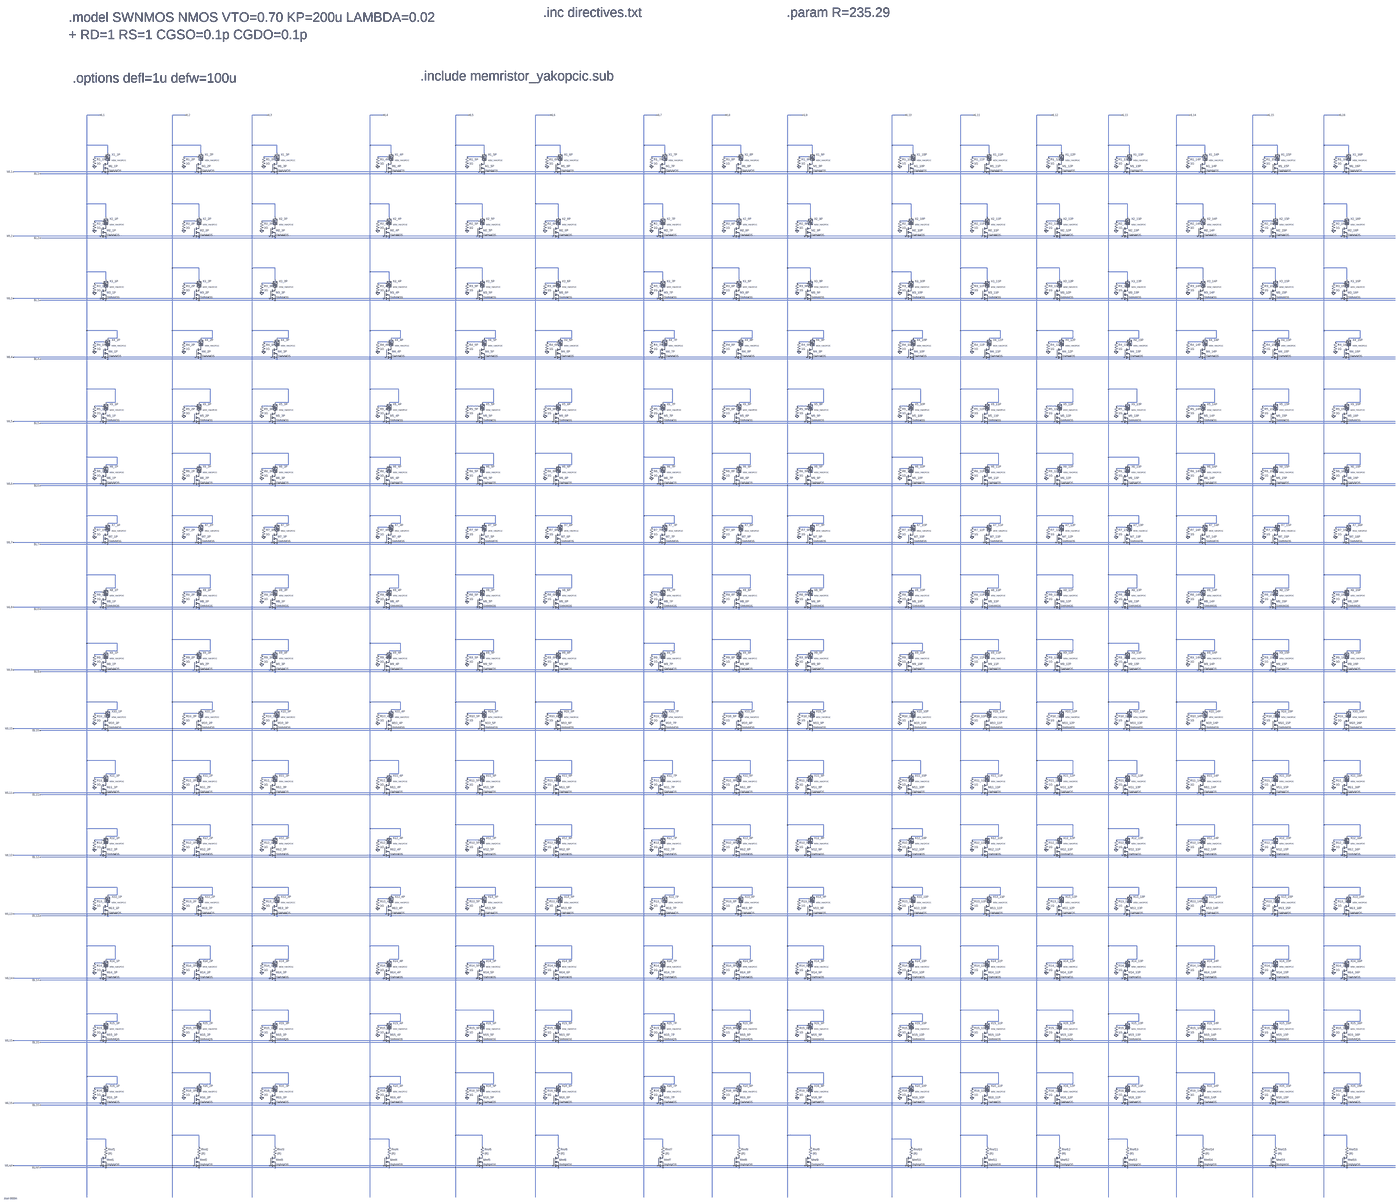
[diagram p0: schematic Trenery-1T1R.asc, whole sheet]
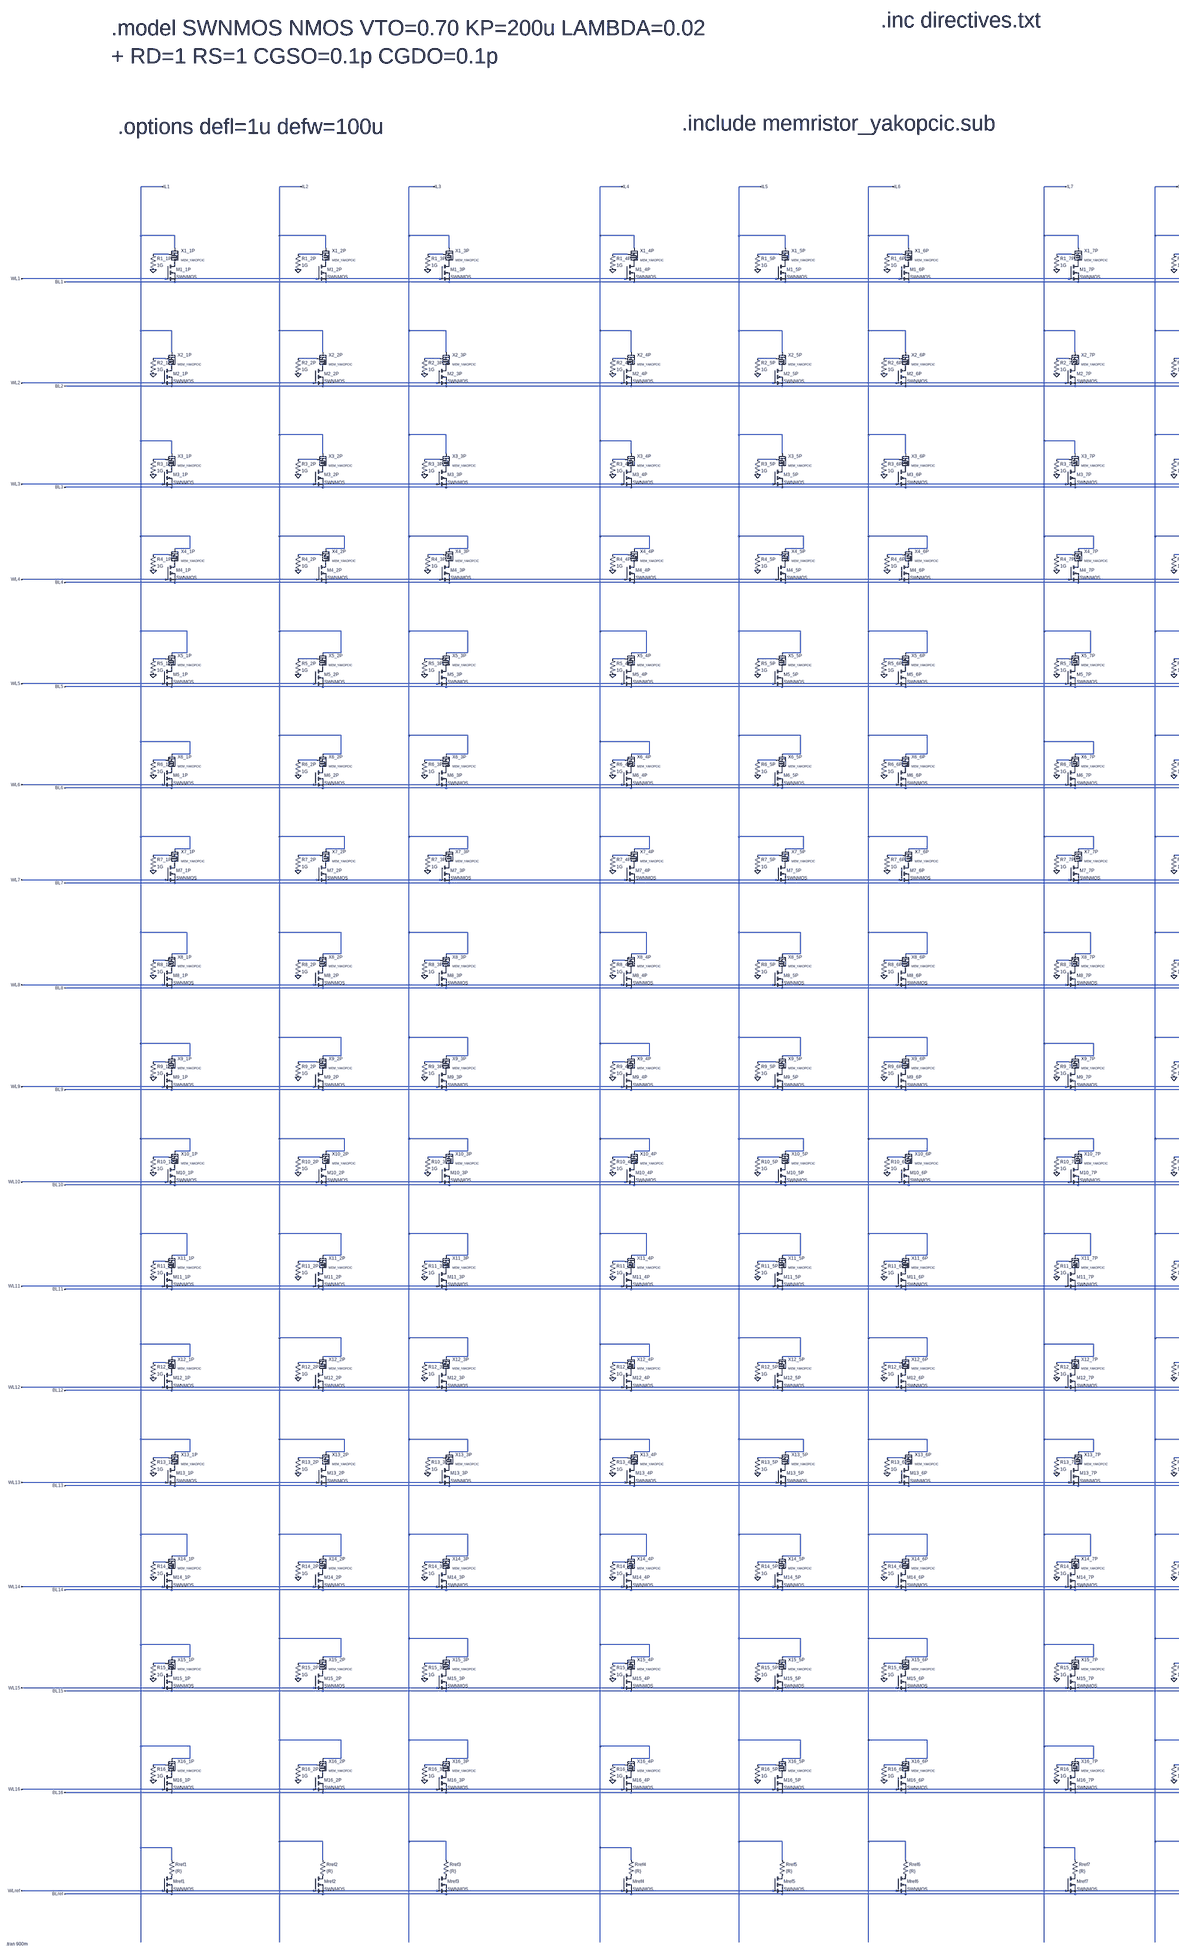
[diagram p1: schematic Trenery-1T1R.asc, part, row 1 of 1, column 1 of 2]
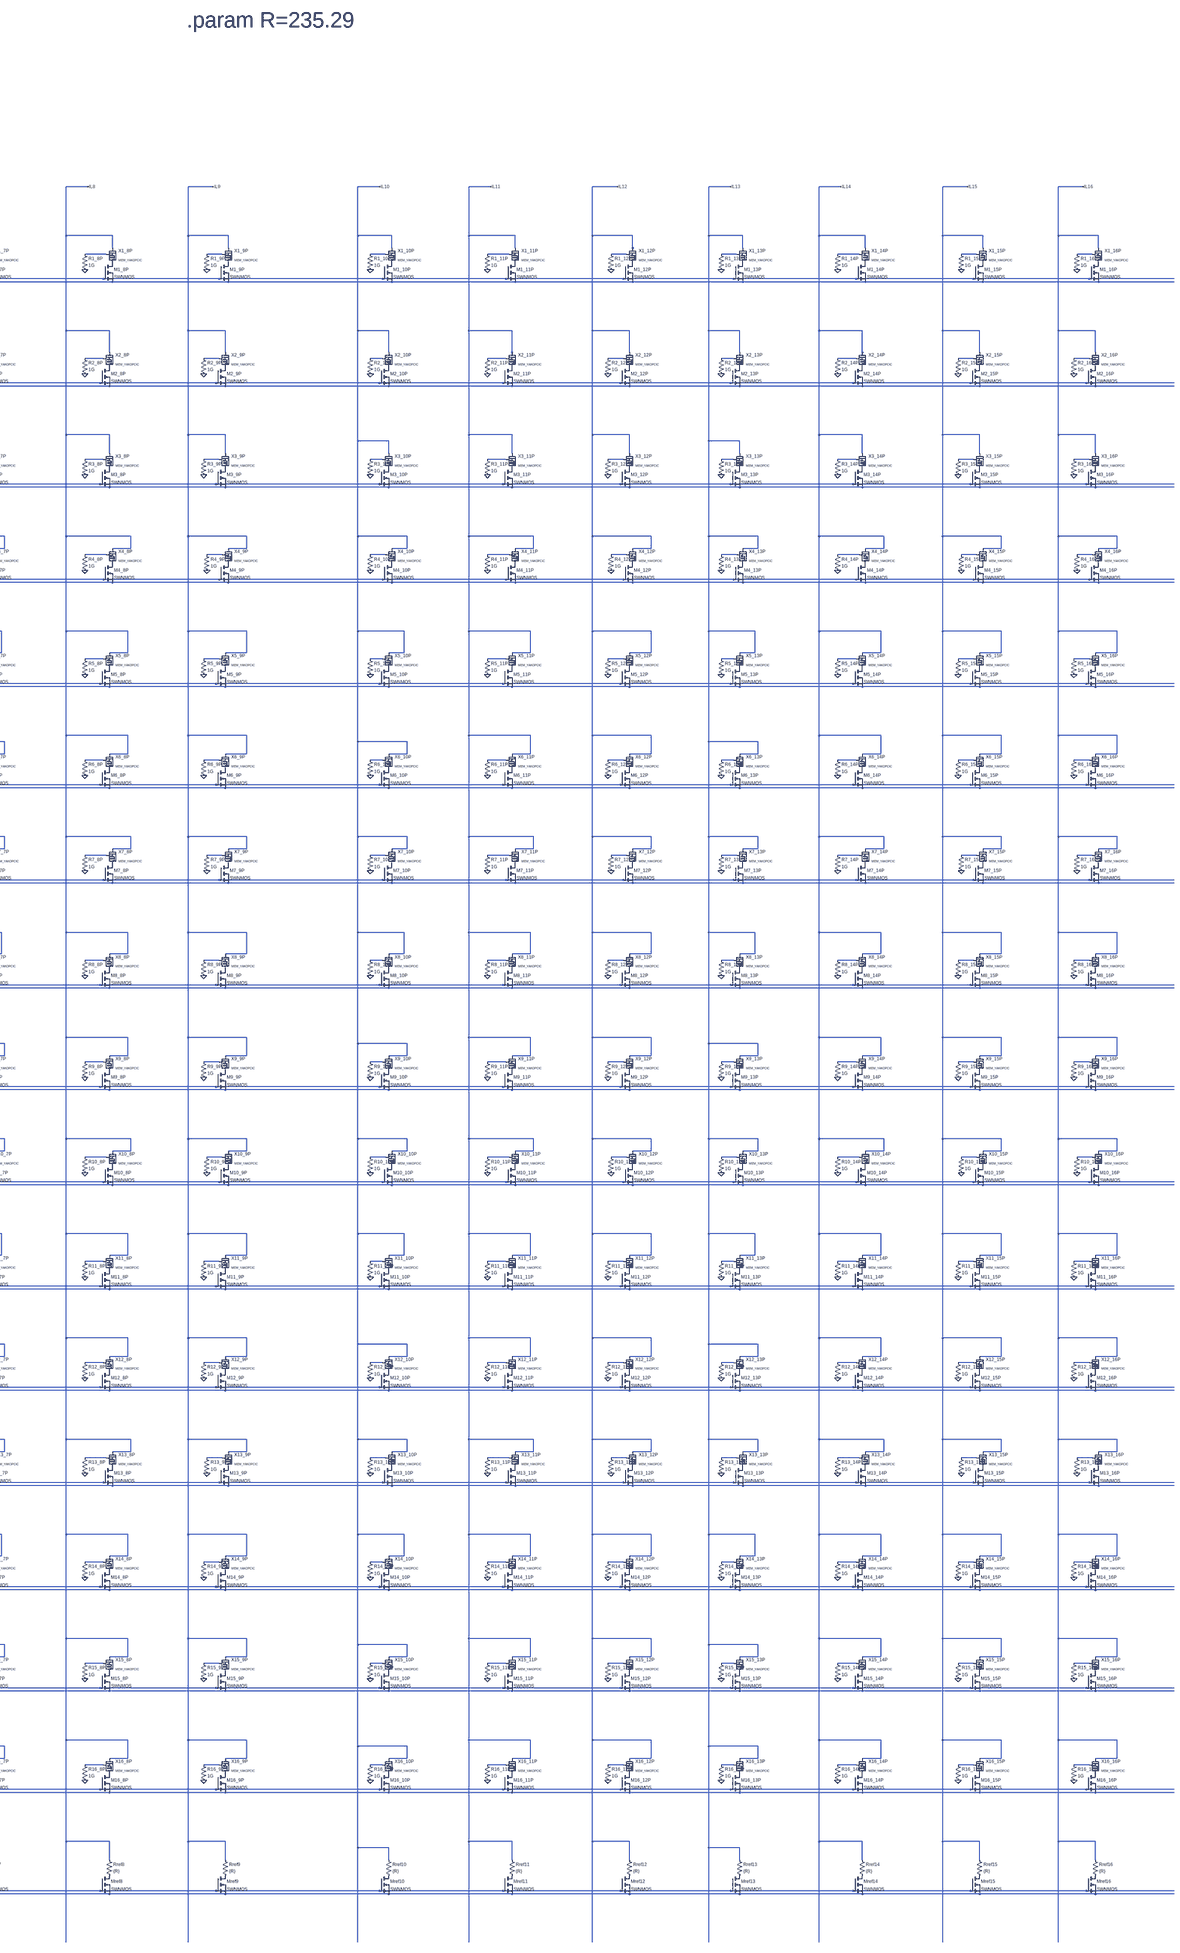
[diagram p2: schematic Trenery-1T1R.asc, part, row 1 of 1, column 2 of 2]
* Trenery-1T1R.asc
M1_1P P001 WL1 BL1 BL1 SWNMOS
M2_1P P002 WL2 BL2 BL2 SWNMOS
M1_2P P003 WL1 BL1 BL1 SWNMOS
M2_2P P004 WL2 BL2 BL2 SWNMOS
M2_3P P005 WL2 BL2 BL2 SWNMOS
M1_3P P006 WL1 BL1 BL1 SWNMOS
M3_1P P007 WL3 BL3 BL3 SWNMOS
M3_2P P008 WL3 BL3 BL3 SWNMOS
M3_3P P009 WL3 BL3 BL3 SWNMOS
X§X2_1P IL1 P002 N017 MEM_YAKOPCIC  ; pins TE BE XSV
X§X2_2P IL2 P004 N018 MEM_YAKOPCIC  ; pins TE BE XSV
X§X2_3P IL3 P005 N019 MEM_YAKOPCIC  ; pins TE BE XSV
X§X1_1P IL1 P001 N001 MEM_YAKOPCIC  ; pins TE BE XSV
X§X1_2P IL2 P003 N002 MEM_YAKOPCIC  ; pins TE BE XSV
X§X1_3P IL3 P006 N003 MEM_YAKOPCIC  ; pins TE BE XSV
X§X3_1P IL1 P007 N033 MEM_YAKOPCIC  ; pins TE BE XSV
X§X3_2P IL2 P008 N034 MEM_YAKOPCIC  ; pins TE BE XSV
X§X3_3P IL3 P009 N035 MEM_YAKOPCIC  ; pins TE BE XSV
R2_1P N017 0 1G
R2_2P N018 0 1G
R2_3P N019 0 1G
R3_1P N033 0 1G
R3_2P N034 0 1G
R3_3P N035 0 1G
R1_1P N001 0 1G tol=1 pwr=0.1
R1_2P N002 0 1G
R1_3P N003 0 1G
M1_4P P010 WL1 BL1 BL1 SWNMOS
M2_4P P011 WL2 BL2 BL2 SWNMOS
M1_5P P012 WL1 BL1 BL1 SWNMOS
M2_5P P013 WL2 BL2 BL2 SWNMOS
M2_6P P014 WL2 BL2 BL2 SWNMOS
M1_6P P015 WL1 BL1 BL1 SWNMOS
M3_4P P016 WL3 BL3 BL3 SWNMOS
M3_5P P017 WL3 BL3 BL3 SWNMOS
M3_6P P018 WL3 BL3 BL3 SWNMOS
X§X2_4P IL4 P011 N020 MEM_YAKOPCIC  ; pins TE BE XSV
X§X2_5P IL5 P013 N021 MEM_YAKOPCIC  ; pins TE BE XSV
X§X2_6P IL6 P014 N022 MEM_YAKOPCIC  ; pins TE BE XSV
X§X1_4P IL4 P010 N004 MEM_YAKOPCIC  ; pins TE BE XSV
X§X1_5P IL5 P012 N005 MEM_YAKOPCIC  ; pins TE BE XSV
X§X1_6P IL6 P015 N006 MEM_YAKOPCIC  ; pins TE BE XSV
X§X3_4P IL4 P016 N036 MEM_YAKOPCIC  ; pins TE BE XSV
X§X3_5P IL5 P017 N037 MEM_YAKOPCIC  ; pins TE BE XSV
X§X3_6P IL6 P018 N038 MEM_YAKOPCIC  ; pins TE BE XSV
R2_4P N020 0 1G
R2_5P N021 0 1G
R2_6P N022 0 1G
R3_4P N036 0 1G
R3_5P N037 0 1G
R3_6P N038 0 1G
R1_4P N004 0 1G tol=1 pwr=0.1
R1_5P N005 0 1G
R1_6P N006 0 1G
M1_7P P019 WL1 BL1 BL1 SWNMOS
M2_7P P020 WL2 BL2 BL2 SWNMOS
M1_8P P021 WL1 BL1 BL1 SWNMOS
M2_8P P022 WL2 BL2 BL2 SWNMOS
M2_9P P023 WL2 BL2 BL2 SWNMOS
M1_9P P024 WL1 BL1 BL1 SWNMOS
M3_7P P025 WL3 BL3 BL3 SWNMOS
M3_8P P026 WL3 BL3 BL3 SWNMOS
M3_9P P027 WL3 BL3 BL3 SWNMOS
X§X2_7P IL7 P020 N023 MEM_YAKOPCIC  ; pins TE BE XSV
X§X2_8P IL8 P022 N024 MEM_YAKOPCIC  ; pins TE BE XSV
X§X2_9P IL9 P023 N025 MEM_YAKOPCIC  ; pins TE BE XSV
X§X1_7P IL7 P019 N007 MEM_YAKOPCIC  ; pins TE BE XSV
X§X1_8P IL8 P021 N008 MEM_YAKOPCIC  ; pins TE BE XSV
X§X1_9P IL9 P024 N009 MEM_YAKOPCIC  ; pins TE BE XSV
X§X3_7P IL7 P025 N039 MEM_YAKOPCIC  ; pins TE BE XSV
X§X3_8P IL8 P026 N040 MEM_YAKOPCIC  ; pins TE BE XSV
X§X3_9P IL9 P027 N041 MEM_YAKOPCIC  ; pins TE BE XSV
R2_7P N023 0 1G
R2_8P N024 0 1G
R2_9P N025 0 1G
R3_7P N039 0 1G
R3_8P N040 0 1G
R3_9P N041 0 1G
R1_7P N007 0 1G tol=1 pwr=0.1
R1_8P N008 0 1G
R1_9P N009 0 1G
M1_10P P028 WL1 BL1 BL1 SWNMOS
M2_10P P029 WL2 BL2 BL2 SWNMOS
M1_11P P030 WL1 BL1 BL1 SWNMOS
M2_11P P031 WL2 BL2 BL2 SWNMOS
M2_12P P032 WL2 BL2 BL2 SWNMOS
M1_12P P033 WL1 BL1 BL1 SWNMOS
M3_10P P034 WL3 BL3 BL3 SWNMOS
M3_11P P035 WL3 BL3 BL3 SWNMOS
M3_12P P036 WL3 BL3 BL3 SWNMOS
X§X2_10P IL10 P029 N026 MEM_YAKOPCIC  ; pins TE BE XSV
X§X2_11P IL11 P031 N027 MEM_YAKOPCIC  ; pins TE BE XSV
X§X2_12P IL12 P032 N028 MEM_YAKOPCIC  ; pins TE BE XSV
X§X1_10P IL10 P028 N010 MEM_YAKOPCIC  ; pins TE BE XSV
X§X1_11P IL11 P030 N011 MEM_YAKOPCIC  ; pins TE BE XSV
X§X1_12P IL12 P033 N012 MEM_YAKOPCIC  ; pins TE BE XSV
X§X3_10P IL10 P034 N042 MEM_YAKOPCIC  ; pins TE BE XSV
X§X3_11P IL11 P035 N043 MEM_YAKOPCIC  ; pins TE BE XSV
X§X3_12P IL12 P036 N044 MEM_YAKOPCIC  ; pins TE BE XSV
R2_10P N026 0 1G
R2_11P N027 0 1G
R2_12P N028 0 1G
R3_10P N042 0 1G
R3_11P N043 0 1G
R3_12P N044 0 1G
R1_10P N010 0 1G tol=1 pwr=0.1
R1_11P N011 0 1G
R1_12P N012 0 1G
M1_13P P037 WL1 BL1 BL1 SWNMOS
M2_13P P038 WL2 BL2 BL2 SWNMOS
M1_14P P039 WL1 BL1 BL1 SWNMOS
M2_14P P040 WL2 BL2 BL2 SWNMOS
M2_15P P041 WL2 BL2 BL2 SWNMOS
M1_15P P042 WL1 BL1 BL1 SWNMOS
M3_13P P043 WL3 BL3 BL3 SWNMOS
M3_14P P044 WL3 BL3 BL3 SWNMOS
M3_15P P045 WL3 BL3 BL3 SWNMOS
X§X2_13P IL13 P038 N029 MEM_YAKOPCIC  ; pins TE BE XSV
X§X2_14P IL14 P040 N030 MEM_YAKOPCIC  ; pins TE BE XSV
X§X2_15P IL15 P041 N031 MEM_YAKOPCIC  ; pins TE BE XSV
X§X1_13P IL13 P037 N013 MEM_YAKOPCIC  ; pins TE BE XSV
X§X1_14P IL14 P039 N014 MEM_YAKOPCIC  ; pins TE BE XSV
X§X1_15P IL15 P042 N015 MEM_YAKOPCIC  ; pins TE BE XSV
X§X3_13P IL13 P043 N045 MEM_YAKOPCIC  ; pins TE BE XSV
X§X3_14P IL14 P044 N046 MEM_YAKOPCIC  ; pins TE BE XSV
X§X3_15P IL15 P045 N047 MEM_YAKOPCIC  ; pins TE BE XSV
R2_13P N029 0 1G
R2_14P N030 0 1G
R2_15P N031 0 1G
R3_13P N045 0 1G
R3_14P N046 0 1G
R3_15P N047 0 1G
R1_13P N013 0 1G tol=1 pwr=0.1
R1_14P N014 0 1G
R1_15P N015 0 1G
M2_16P P046 WL2 BL2 BL2 SWNMOS
M1_16P P047 WL1 BL1 BL1 SWNMOS
M3_16P P048 WL3 BL3 BL3 SWNMOS
X§X2_16P IL16 P046 N032 MEM_YAKOPCIC  ; pins TE BE XSV
X§X1_16P IL16 P047 N016 MEM_YAKOPCIC  ; pins TE BE XSV
X§X3_16P IL16 P048 N048 MEM_YAKOPCIC  ; pins TE BE XSV
R2_16P N032 0 1G
R3_16P N048 0 1G
R1_16P N016 0 1G
M4_1P P049 WL4 BL4 BL4 SWNMOS
M5_1P P050 WL5 BL5 BL5 SWNMOS
M4_2P P051 WL4 BL4 BL4 SWNMOS
M5_2P P052 WL5 BL5 BL5 SWNMOS
M5_3P P053 WL5 BL5 BL5 SWNMOS
M4_3P P054 WL4 BL4 BL4 SWNMOS
M6_1P P055 WL6 BL6 BL6 SWNMOS
M6_2P P056 WL6 BL6 BL6 SWNMOS
M6_3P P057 WL6 BL6 BL6 SWNMOS
X§X5_1P IL1 P050 N065 MEM_YAKOPCIC  ; pins TE BE XSV
X§X5_2P IL2 P052 N066 MEM_YAKOPCIC  ; pins TE BE XSV
X§X5_3P IL3 P053 N067 MEM_YAKOPCIC  ; pins TE BE XSV
X§X4_1P IL1 P049 N049 MEM_YAKOPCIC  ; pins TE BE XSV
X§X4_2P IL2 P051 N050 MEM_YAKOPCIC  ; pins TE BE XSV
X§X4_3P IL3 P054 N051 MEM_YAKOPCIC  ; pins TE BE XSV
X§X6_1P IL1 P055 N081 MEM_YAKOPCIC  ; pins TE BE XSV
X§X6_2P IL2 P056 N082 MEM_YAKOPCIC  ; pins TE BE XSV
X§X6_3P IL3 P057 N083 MEM_YAKOPCIC  ; pins TE BE XSV
R5_1P N065 0 1G
R5_2P N066 0 1G
R5_3P N067 0 1G
R6_1P N081 0 1G
R6_2P N082 0 1G
R6_3P N083 0 1G
R4_1P N049 0 1G tol=1 pwr=0.1
R4_2P N050 0 1G
R4_3P N051 0 1G
M4_4P P058 WL4 BL4 BL4 SWNMOS
M5_4P P059 WL5 BL5 BL5 SWNMOS
M4_5P P060 WL4 BL4 BL4 SWNMOS
M5_5P P061 WL5 BL5 BL5 SWNMOS
M5_6P P062 WL5 BL5 BL5 SWNMOS
M4_6P P063 WL4 BL4 BL4 SWNMOS
M6_4P P064 WL6 BL6 BL6 SWNMOS
M6_5P P065 WL6 BL6 BL6 SWNMOS
M6_6P P066 WL6 BL6 BL6 SWNMOS
X§X5_4P IL4 P059 N068 MEM_YAKOPCIC  ; pins TE BE XSV
X§X5_5P IL5 P061 N069 MEM_YAKOPCIC  ; pins TE BE XSV
X§X5_6P IL6 P062 N070 MEM_YAKOPCIC  ; pins TE BE XSV
X§X4_4P IL4 P058 N052 MEM_YAKOPCIC  ; pins TE BE XSV
X§X4_5P IL5 P060 N053 MEM_YAKOPCIC  ; pins TE BE XSV
X§X4_6P IL6 P063 N054 MEM_YAKOPCIC  ; pins TE BE XSV
X§X6_4P IL4 P064 N084 MEM_YAKOPCIC  ; pins TE BE XSV
X§X6_5P IL5 P065 N085 MEM_YAKOPCIC  ; pins TE BE XSV
X§X6_6P IL6 P066 N086 MEM_YAKOPCIC  ; pins TE BE XSV
R5_4P N068 0 1G
R5_5P N069 0 1G
R5_6P N070 0 1G
R6_4P N084 0 1G
R6_5P N085 0 1G
R6_6P N086 0 1G
R4_4P N052 0 1G tol=1 pwr=0.1
R4_5P N053 0 1G
R4_6P N054 0 1G
M4_7P P067 WL4 BL4 BL4 SWNMOS
M5_7P P068 WL5 BL5 BL5 SWNMOS
M4_8P P069 WL4 BL4 BL4 SWNMOS
M5_8P P070 WL5 BL5 BL5 SWNMOS
M5_9P P071 WL5 BL5 BL5 SWNMOS
M4_9P P072 WL4 BL4 BL4 SWNMOS
M6_7P P073 WL6 BL6 BL6 SWNMOS
M6_8P P074 WL6 BL6 BL6 SWNMOS
M6_9P P075 WL6 BL6 BL6 SWNMOS
X§X5_7P IL7 P068 N071 MEM_YAKOPCIC  ; pins TE BE XSV
X§X5_8P IL8 P070 N072 MEM_YAKOPCIC  ; pins TE BE XSV
X§X5_9P IL9 P071 N073 MEM_YAKOPCIC  ; pins TE BE XSV
X§X4_7P IL7 P067 N055 MEM_YAKOPCIC  ; pins TE BE XSV
X§X4_8P IL8 P069 N056 MEM_YAKOPCIC  ; pins TE BE XSV
X§X4_9P IL9 P072 N057 MEM_YAKOPCIC  ; pins TE BE XSV
X§X6_7P IL7 P073 N087 MEM_YAKOPCIC  ; pins TE BE XSV
X§X6_8P IL8 P074 N088 MEM_YAKOPCIC  ; pins TE BE XSV
X§X6_9P IL9 P075 N089 MEM_YAKOPCIC  ; pins TE BE XSV
R5_7P N071 0 1G
R5_8P N072 0 1G
R5_9P N073 0 1G
R6_7P N087 0 1G
R6_8P N088 0 1G
R6_9P N089 0 1G
R4_7P N055 0 1G tol=1 pwr=0.1
R4_8P N056 0 1G
R4_9P N057 0 1G
M4_10P P076 WL4 BL4 BL4 SWNMOS
M5_10P P077 WL5 BL5 BL5 SWNMOS
M4_11P P078 WL4 BL4 BL4 SWNMOS
M5_11P P079 WL5 BL5 BL5 SWNMOS
M5_12P P080 WL5 BL5 BL5 SWNMOS
M4_12P P081 WL4 BL4 BL4 SWNMOS
M6_10P P082 WL6 BL6 BL6 SWNMOS
M6_11P P083 WL6 BL6 BL6 SWNMOS
M6_12P P084 WL6 BL6 BL6 SWNMOS
X§X5_10P IL10 P077 N074 MEM_YAKOPCIC  ; pins TE BE XSV
X§X5_11P IL11 P079 N075 MEM_YAKOPCIC  ; pins TE BE XSV
X§X5_12P IL12 P080 N076 MEM_YAKOPCIC  ; pins TE BE XSV
X§X4_10P IL10 P076 N058 MEM_YAKOPCIC  ; pins TE BE XSV
X§X4_11P IL11 P078 N059 MEM_YAKOPCIC  ; pins TE BE XSV
X§X4_12P IL12 P081 N060 MEM_YAKOPCIC  ; pins TE BE XSV
X§X6_10P IL10 P082 N090 MEM_YAKOPCIC  ; pins TE BE XSV
X§X6_11P IL11 P083 N091 MEM_YAKOPCIC  ; pins TE BE XSV
X§X6_12P IL12 P084 N092 MEM_YAKOPCIC  ; pins TE BE XSV
R5_10P N074 0 1G
R5_11P N075 0 1G
R5_12P N076 0 1G
R6_10P N090 0 1G
R6_11P N091 0 1G
R6_12P N092 0 1G
R4_10P N058 0 1G tol=1 pwr=0.1
R4_11P N059 0 1G
R4_12P N060 0 1G
M4_13P P085 WL4 BL4 BL4 SWNMOS
M5_13P P086 WL5 BL5 BL5 SWNMOS
M4_14P P087 WL4 BL4 BL4 SWNMOS
M5_14P P088 WL5 BL5 BL5 SWNMOS
M5_15P P089 WL5 BL5 BL5 SWNMOS
M4_15P P090 WL4 BL4 BL4 SWNMOS
M6_13P P091 WL6 BL6 BL6 SWNMOS
M6_14P P092 WL6 BL6 BL6 SWNMOS
M6_15P P093 WL6 BL6 BL6 SWNMOS
X§X5_13P IL13 P086 N077 MEM_YAKOPCIC  ; pins TE BE XSV
X§X5_14P IL14 P088 N078 MEM_YAKOPCIC  ; pins TE BE XSV
X§X5_15P IL15 P089 N079 MEM_YAKOPCIC  ; pins TE BE XSV
X§X4_13P IL13 P085 N061 MEM_YAKOPCIC  ; pins TE BE XSV
X§X4_14P IL14 P087 N062 MEM_YAKOPCIC  ; pins TE BE XSV
X§X4_15P IL15 P090 N063 MEM_YAKOPCIC  ; pins TE BE XSV
X§X6_13P IL13 P091 N093 MEM_YAKOPCIC  ; pins TE BE XSV
X§X6_14P IL14 P092 N094 MEM_YAKOPCIC  ; pins TE BE XSV
X§X6_15P IL15 P093 N095 MEM_YAKOPCIC  ; pins TE BE XSV
R5_13P N077 0 1G
R5_14P N078 0 1G
R5_15P N079 0 1G
R6_13P N093 0 1G
R6_14P N094 0 1G
R6_15P N095 0 1G
R4_13P N061 0 1G tol=1 pwr=0.1
R4_14P N062 0 1G
R4_15P N063 0 1G
M5_16P P094 WL5 BL5 BL5 SWNMOS
M4_16P P095 WL4 BL4 BL4 SWNMOS
M6_16P P096 WL6 BL6 BL6 SWNMOS
X§X5_16P IL16 P094 N080 MEM_YAKOPCIC  ; pins TE BE XSV
X§X4_16P IL16 P095 N064 MEM_YAKOPCIC  ; pins TE BE XSV
X§X6_16P IL16 P096 N096 MEM_YAKOPCIC  ; pins TE BE XSV
R5_16P N080 0 1G
R6_16P N096 0 1G
R4_16P N064 0 1G
M7_1P P097 WL7 BL7 BL7 SWNMOS
M8_1P P098 WL8 BL8 BL8 SWNMOS
M7_2P P099 WL7 BL7 BL7 SWNMOS
M8_2P P100 WL8 BL8 BL8 SWNMOS
M8_3P P101 WL8 BL8 BL8 SWNMOS
M7_3P P102 WL7 BL7 BL7 SWNMOS
M9_1P P103 WL9 BL9 BL9 SWNMOS
M9_2P P104 WL9 BL9 BL9 SWNMOS
M9_3P P105 WL9 BL9 BL9 SWNMOS
X§X8_1P IL1 P098 N113 MEM_YAKOPCIC  ; pins TE BE XSV
X§X8_2P IL2 P100 N114 MEM_YAKOPCIC  ; pins TE BE XSV
X§X8_3P IL3 P101 N115 MEM_YAKOPCIC  ; pins TE BE XSV
X§X7_1P IL1 P097 N097 MEM_YAKOPCIC  ; pins TE BE XSV
X§X7_2P IL2 P099 N098 MEM_YAKOPCIC  ; pins TE BE XSV
X§X7_3P IL3 P102 N099 MEM_YAKOPCIC  ; pins TE BE XSV
X§X9_1P IL1 P103 N129 MEM_YAKOPCIC  ; pins TE BE XSV
X§X9_2P IL2 P104 N130 MEM_YAKOPCIC  ; pins TE BE XSV
X§X9_3P IL3 P105 N131 MEM_YAKOPCIC  ; pins TE BE XSV
R8_1P N113 0 1G
R8_2P N114 0 1G
R8_3P N115 0 1G
R9_1P N129 0 1G
R9_2P N130 0 1G
R9_3P N131 0 1G
R7_1P N097 0 1G tol=1 pwr=0.1
R7_2P N098 0 1G
R7_3P N099 0 1G
M7_4P P106 WL7 BL7 BL7 SWNMOS
M8_4P P107 WL8 BL8 BL8 SWNMOS
M7_5P P108 WL7 BL7 BL7 SWNMOS
M8_5P P109 WL8 BL8 BL8 SWNMOS
M8_6P P110 WL8 BL8 BL8 SWNMOS
M7_6P P111 WL7 BL7 BL7 SWNMOS
M9_4P P112 WL9 BL9 BL9 SWNMOS
M9_5P P113 WL9 BL9 BL9 SWNMOS
M9_6P P114 WL9 BL9 BL9 SWNMOS
X§X8_4P IL4 P107 N116 MEM_YAKOPCIC  ; pins TE BE XSV
X§X8_5P IL5 P109 N117 MEM_YAKOPCIC  ; pins TE BE XSV
X§X8_6P IL6 P110 N118 MEM_YAKOPCIC  ; pins TE BE XSV
X§X7_4P IL4 P106 N100 MEM_YAKOPCIC  ; pins TE BE XSV
X§X7_5P IL5 P108 N101 MEM_YAKOPCIC  ; pins TE BE XSV
X§X7_6P IL6 P111 N102 MEM_YAKOPCIC  ; pins TE BE XSV
X§X9_4P IL4 P112 N132 MEM_YAKOPCIC  ; pins TE BE XSV
X§X9_5P IL5 P113 N133 MEM_YAKOPCIC  ; pins TE BE XSV
X§X9_6P IL6 P114 N134 MEM_YAKOPCIC  ; pins TE BE XSV
R8_4P N116 0 1G
R8_5P N117 0 1G
R8_6P N118 0 1G
R9_4P N132 0 1G
R9_5P N133 0 1G
R9_6P N134 0 1G
R7_4P N100 0 1G tol=1 pwr=0.1
R7_5P N101 0 1G
R7_6P N102 0 1G
M7_7P P115 WL7 BL7 BL7 SWNMOS
M8_7P P116 WL8 BL8 BL8 SWNMOS
M7_8P P117 WL7 BL7 BL7 SWNMOS
M8_8P P118 WL8 BL8 BL8 SWNMOS
M8_9P P119 WL8 BL8 BL8 SWNMOS
M7_9P P120 WL7 BL7 BL7 SWNMOS
M9_7P P121 WL9 BL9 BL9 SWNMOS
M9_8P P122 WL9 BL9 BL9 SWNMOS
M9_9P P123 WL9 BL9 BL9 SWNMOS
X§X8_7P IL7 P116 N119 MEM_YAKOPCIC  ; pins TE BE XSV
X§X8_8P IL8 P118 N120 MEM_YAKOPCIC  ; pins TE BE XSV
X§X8_9P IL9 P119 N121 MEM_YAKOPCIC  ; pins TE BE XSV
X§X7_7P IL7 P115 N103 MEM_YAKOPCIC  ; pins TE BE XSV
X§X7_8P IL8 P117 N104 MEM_YAKOPCIC  ; pins TE BE XSV
X§X7_9P IL9 P120 N105 MEM_YAKOPCIC  ; pins TE BE XSV
X§X9_7P IL7 P121 N135 MEM_YAKOPCIC  ; pins TE BE XSV
X§X9_8P IL8 P122 N136 MEM_YAKOPCIC  ; pins TE BE XSV
X§X9_9P IL9 P123 N137 MEM_YAKOPCIC  ; pins TE BE XSV
R8_7P N119 0 1G
R8_8P N120 0 1G
R8_9P N121 0 1G
R9_7P N135 0 1G
R9_8P N136 0 1G
R9_9P N137 0 1G
R7_7P N103 0 1G tol=1 pwr=0.1
R7_8P N104 0 1G
R7_9P N105 0 1G
M7_10P P124 WL7 BL7 BL7 SWNMOS
M8_10P P125 WL8 BL8 BL8 SWNMOS
M7_11P P126 WL7 BL7 BL7 SWNMOS
M8_11P P127 WL8 BL8 BL8 SWNMOS
M8_12P P128 WL8 BL8 BL8 SWNMOS
M7_12P P129 WL7 BL7 BL7 SWNMOS
M9_10P P130 WL9 BL9 BL9 SWNMOS
M9_11P P131 WL9 BL9 BL9 SWNMOS
M9_12P P132 WL9 BL9 BL9 SWNMOS
X§X8_10P IL10 P125 N122 MEM_YAKOPCIC  ; pins TE BE XSV
X§X8_11P IL11 P127 N123 MEM_YAKOPCIC  ; pins TE BE XSV
X§X8_12P IL12 P128 N124 MEM_YAKOPCIC  ; pins TE BE XSV
X§X7_10P IL10 P124 N106 MEM_YAKOPCIC  ; pins TE BE XSV
X§X7_11P IL11 P126 N107 MEM_YAKOPCIC  ; pins TE BE XSV
X§X7_12P IL12 P129 N108 MEM_YAKOPCIC  ; pins TE BE XSV
X§X9_10P IL10 P130 N138 MEM_YAKOPCIC  ; pins TE BE XSV
X§X9_11P IL11 P131 N139 MEM_YAKOPCIC  ; pins TE BE XSV
X§X9_12P IL12 P132 N140 MEM_YAKOPCIC  ; pins TE BE XSV
R8_10P N122 0 1G
R8_11P N123 0 1G
R8_12P N124 0 1G
R9_10P N138 0 1G
R9_11P N139 0 1G
R9_12P N140 0 1G
R7_10P N106 0 1G tol=1 pwr=0.1
R7_11P N107 0 1G
R7_12P N108 0 1G
M7_13P P133 WL7 BL7 BL7 SWNMOS
M8_13P P134 WL8 BL8 BL8 SWNMOS
M7_14P P135 WL7 BL7 BL7 SWNMOS
M8_14P P136 WL8 BL8 BL8 SWNMOS
M8_15P P137 WL8 BL8 BL8 SWNMOS
M7_15P P138 WL7 BL7 BL7 SWNMOS
M9_13P P139 WL9 BL9 BL9 SWNMOS
M9_14P P140 WL9 BL9 BL9 SWNMOS
M9_15P P141 WL9 BL9 BL9 SWNMOS
X§X8_13P IL13 P134 N125 MEM_YAKOPCIC  ; pins TE BE XSV
X§X8_14P IL14 P136 N126 MEM_YAKOPCIC  ; pins TE BE XSV
X§X8_15P IL15 P137 N127 MEM_YAKOPCIC  ; pins TE BE XSV
X§X7_13P IL13 P133 N109 MEM_YAKOPCIC  ; pins TE BE XSV
X§X7_14P IL14 P135 N110 MEM_YAKOPCIC  ; pins TE BE XSV
X§X7_15P IL15 P138 N111 MEM_YAKOPCIC  ; pins TE BE XSV
X§X9_13P IL13 P139 N141 MEM_YAKOPCIC  ; pins TE BE XSV
X§X9_14P IL14 P140 N142 MEM_YAKOPCIC  ; pins TE BE XSV
X§X9_15P IL15 P141 N143 MEM_YAKOPCIC  ; pins TE BE XSV
R8_13P N125 0 1G
R8_14P N126 0 1G
R8_15P N127 0 1G
R9_13P N141 0 1G
R9_14P N142 0 1G
R9_15P N143 0 1G
R7_13P N109 0 1G tol=1 pwr=0.1
R7_14P N110 0 1G
R7_15P N111 0 1G
M8_16P P142 WL8 BL8 BL8 SWNMOS
M7_16P P143 WL7 BL7 BL7 SWNMOS
M9_16P P144 WL9 BL9 BL9 SWNMOS
X§X8_16P IL16 P142 N128 MEM_YAKOPCIC  ; pins TE BE XSV
X§X7_16P IL16 P143 N112 MEM_YAKOPCIC  ; pins TE BE XSV
X§X9_16P IL16 P144 N144 MEM_YAKOPCIC  ; pins TE BE XSV
R8_16P N128 0 1G
R9_16P N144 0 1G
R7_16P N112 0 1G
M10_1P P145 WL10 BL10 BL10 SWNMOS
M11_1P P146 WL11 BL11 BL11 SWNMOS
M10_2P P147 WL10 BL10 BL10 SWNMOS
M11_2P P148 WL11 BL11 BL11 SWNMOS
M11_3P P149 WL11 BL11 BL11 SWNMOS
M10_3P P150 WL10 BL10 BL10 SWNMOS
M12_1P P151 WL12 BL12 BL12 SWNMOS
M12_2P P152 WL12 BL12 BL12 SWNMOS
M12_3P P153 WL12 BL12 BL12 SWNMOS
X§X11_1P IL1 P146 N161 MEM_YAKOPCIC  ; pins TE BE XSV
X§X11_2P IL2 P148 N162 MEM_YAKOPCIC  ; pins TE BE XSV
X§X11_3P IL3 P149 N163 MEM_YAKOPCIC  ; pins TE BE XSV
X§X10_1P IL1 P145 N145 MEM_YAKOPCIC  ; pins TE BE XSV
X§X10_2P IL2 P147 N146 MEM_YAKOPCIC  ; pins TE BE XSV
X§X10_3P IL3 P150 N147 MEM_YAKOPCIC  ; pins TE BE XSV
X§X12_1P IL1 P151 N177 MEM_YAKOPCIC  ; pins TE BE XSV
X§X12_2P IL2 P152 N178 MEM_YAKOPCIC  ; pins TE BE XSV
X§X12_3P IL3 P153 N179 MEM_YAKOPCIC  ; pins TE BE XSV
R11_1P N161 0 1G
R11_2P N162 0 1G
R11_3P N163 0 1G
R12_1P N177 0 1G
R12_2P N178 0 1G
R12_3P N179 0 1G
R10_1P N145 0 1G tol=1 pwr=0.1
R10_2P N146 0 1G
R10_3P N147 0 1G
M10_4P P154 WL10 BL10 BL10 SWNMOS
M11_4P P155 WL11 BL11 BL11 SWNMOS
M10_5P P156 WL10 BL10 BL10 SWNMOS
M11_5P P157 WL11 BL11 BL11 SWNMOS
M11_6P P158 WL11 BL11 BL11 SWNMOS
M10_6P P159 WL10 BL10 BL10 SWNMOS
M12_4P P160 WL12 BL12 BL12 SWNMOS
M12_5P P161 WL12 BL12 BL12 SWNMOS
M12_6P P162 WL12 BL12 BL12 SWNMOS
X§X11_4P IL4 P155 N164 MEM_YAKOPCIC  ; pins TE BE XSV
X§X11_5P IL5 P157 N165 MEM_YAKOPCIC  ; pins TE BE XSV
X§X11_6P IL6 P158 N166 MEM_YAKOPCIC  ; pins TE BE XSV
X§X10_4P IL4 P154 N148 MEM_YAKOPCIC  ; pins TE BE XSV
X§X10_5P IL5 P156 N149 MEM_YAKOPCIC  ; pins TE BE XSV
X§X10_6P IL6 P159 N150 MEM_YAKOPCIC  ; pins TE BE XSV
X§X12_4P IL4 P160 N180 MEM_YAKOPCIC  ; pins TE BE XSV
X§X12_5P IL5 P161 N181 MEM_YAKOPCIC  ; pins TE BE XSV
X§X12_6P IL6 P162 N182 MEM_YAKOPCIC  ; pins TE BE XSV
R11_4P N164 0 1G
R11_5P N165 0 1G
R11_6P N166 0 1G
R12_4P N180 0 1G
R12_5P N181 0 1G
R12_6P N182 0 1G
R10_4P N148 0 1G tol=1 pwr=0.1
R10_5P N149 0 1G
R10_6P N150 0 1G
M10_7P P163 WL10 BL10 BL10 SWNMOS
M11_7P P164 WL11 BL11 BL11 SWNMOS
M10_8P P165 WL10 BL10 BL10 SWNMOS
M11_8P P166 WL11 BL11 BL11 SWNMOS
M11_9P P167 WL11 BL11 BL11 SWNMOS
M10_9P P168 WL10 BL10 BL10 SWNMOS
M12_7P P169 WL12 BL12 BL12 SWNMOS
M12_8P P170 WL12 BL12 BL12 SWNMOS
M12_9P P171 WL12 BL12 BL12 SWNMOS
X§X11_7P IL7 P164 N167 MEM_YAKOPCIC  ; pins TE BE XSV
X§X11_8P IL8 P166 N168 MEM_YAKOPCIC  ; pins TE BE XSV
X§X11_9P IL9 P167 N169 MEM_YAKOPCIC  ; pins TE BE XSV
X§X10_7P IL7 P163 N151 MEM_YAKOPCIC  ; pins TE BE XSV
X§X10_8P IL8 P165 N152 MEM_YAKOPCIC  ; pins TE BE XSV
X§X10_9P IL9 P168 N153 MEM_YAKOPCIC  ; pins TE BE XSV
X§X12_7P IL7 P169 N183 MEM_YAKOPCIC  ; pins TE BE XSV
X§X12_8P IL8 P170 N184 MEM_YAKOPCIC  ; pins TE BE XSV
X§X12_9P IL9 P171 N185 MEM_YAKOPCIC  ; pins TE BE XSV
R11_7P N167 0 1G
R11_8P N168 0 1G
R11_9P N169 0 1G
R12_7P N183 0 1G
R12_8P N184 0 1G
R12_9P N185 0 1G
R10_7P N151 0 1G tol=1 pwr=0.1
R10_8P N152 0 1G
R10_9P N153 0 1G
M10_10P P172 WL10 BL10 BL10 SWNMOS
M11_10P P173 WL11 BL11 BL11 SWNMOS
M10_11P P174 WL10 BL10 BL10 SWNMOS
M11_11P P175 WL11 BL11 BL11 SWNMOS
M11_12P P176 WL11 BL11 BL11 SWNMOS
M10_12P P177 WL10 BL10 BL10 SWNMOS
M12_10P P178 WL12 BL12 BL12 SWNMOS
M12_11P P179 WL12 BL12 BL12 SWNMOS
M12_12P P180 WL12 BL12 BL12 SWNMOS
X§X11_10P IL10 P173 N170 MEM_YAKOPCIC  ; pins TE BE XSV
X§X11_11P IL11 P175 N171 MEM_YAKOPCIC  ; pins TE BE XSV
X§X11_12P IL12 P176 N172 MEM_YAKOPCIC  ; pins TE BE XSV
X§X10_10P IL10 P172 N154 MEM_YAKOPCIC  ; pins TE BE XSV
X§X10_11P IL11 P174 N155 MEM_YAKOPCIC  ; pins TE BE XSV
X§X10_12P IL12 P177 N156 MEM_YAKOPCIC  ; pins TE BE XSV
X§X12_10P IL10 P178 N186 MEM_YAKOPCIC  ; pins TE BE XSV
X§X12_11P IL11 P179 N187 MEM_YAKOPCIC  ; pins TE BE XSV
X§X12_12P IL12 P180 N188 MEM_YAKOPCIC  ; pins TE BE XSV
R11_10P N170 0 1G
R11_11P N171 0 1G
R11_12P N172 0 1G
R12_10P N186 0 1G
R12_11P N187 0 1G
R12_12P N188 0 1G
R10_10P N154 0 1G tol=1 pwr=0.1
R10_11P N155 0 1G
R10_12P N156 0 1G
M10_13P P181 WL10 BL10 BL10 SWNMOS
M11_13P P182 WL11 BL11 BL11 SWNMOS
M10_14P P183 WL10 BL10 BL10 SWNMOS
M11_14P P184 WL11 BL11 BL11 SWNMOS
M11_15P P185 WL11 BL11 BL11 SWNMOS
M10_15P P186 WL10 BL10 BL10 SWNMOS
M12_13P P187 WL12 BL12 BL12 SWNMOS
M12_14P P188 WL12 BL12 BL12 SWNMOS
M12_15P P189 WL12 BL12 BL12 SWNMOS
X§X11_13P IL13 P182 N173 MEM_YAKOPCIC  ; pins TE BE XSV
X§X11_14P IL14 P184 N174 MEM_YAKOPCIC  ; pins TE BE XSV
X§X11_15P IL15 P185 N175 MEM_YAKOPCIC  ; pins TE BE XSV
X§X10_13P IL13 P181 N157 MEM_YAKOPCIC  ; pins TE BE XSV
X§X10_14P IL14 P183 N158 MEM_YAKOPCIC  ; pins TE BE XSV
X§X10_15P IL15 P186 N159 MEM_YAKOPCIC  ; pins TE BE XSV
X§X12_13P IL13 P187 N189 MEM_YAKOPCIC  ; pins TE BE XSV
X§X12_14P IL14 P188 N190 MEM_YAKOPCIC  ; pins TE BE XSV
X§X12_15P IL15 P189 N191 MEM_YAKOPCIC  ; pins TE BE XSV
R11_13P N173 0 1G
R11_14P N174 0 1G
R11_15P N175 0 1G
R12_13P N189 0 1G
R12_14P N190 0 1G
R12_15P N191 0 1G
R10_13P N157 0 1G tol=1 pwr=0.1
R10_14P N158 0 1G
R10_15P N159 0 1G
M11_16P P190 WL11 BL11 BL11 SWNMOS
M10_16P P191 WL10 BL10 BL10 SWNMOS
M12_16P P192 WL12 BL12 BL12 SWNMOS
X§X11_16P IL16 P190 N176 MEM_YAKOPCIC  ; pins TE BE XSV
X§X10_16P IL16 P191 N160 MEM_YAKOPCIC  ; pins TE BE XSV
X§X12_16P IL16 P192 N192 MEM_YAKOPCIC  ; pins TE BE XSV
R11_16P N176 0 1G
R12_16P N192 0 1G
R10_16P N160 0 1G
M13_1P P193 WL13 BL13 BL13 SWNMOS
M14_1P P194 WL14 BL14 BL14 SWNMOS
M13_2P P195 WL13 BL13 BL13 SWNMOS
M14_2P P196 WL14 BL14 BL14 SWNMOS
M14_3P P197 WL14 BL14 BL14 SWNMOS
M13_3P P198 WL13 BL13 BL13 SWNMOS
M15_1P P199 WL15 BL15 BL15 SWNMOS
M15_2P P200 WL15 BL15 BL15 SWNMOS
M15_3P P201 WL15 BL15 BL15 SWNMOS
X§X14_1P IL1 P194 N209 MEM_YAKOPCIC  ; pins TE BE XSV
X§X14_2P IL2 P196 N210 MEM_YAKOPCIC  ; pins TE BE XSV
X§X14_3P IL3 P197 N211 MEM_YAKOPCIC  ; pins TE BE XSV
X§X13_1P IL1 P193 N193 MEM_YAKOPCIC  ; pins TE BE XSV
X§X13_2P IL2 P195 N194 MEM_YAKOPCIC  ; pins TE BE XSV
X§X13_3P IL3 P198 N195 MEM_YAKOPCIC  ; pins TE BE XSV
X§X15_1P IL1 P199 N225 MEM_YAKOPCIC  ; pins TE BE XSV
X§X15_2P IL2 P200 N226 MEM_YAKOPCIC  ; pins TE BE XSV
X§X15_3P IL3 P201 N227 MEM_YAKOPCIC  ; pins TE BE XSV
R14_1P N209 0 1G
R14_2P N210 0 1G
R14_3P N211 0 1G
R15_1P N225 0 1G
R15_2P N226 0 1G
R15_3P N227 0 1G
R13_1P N193 0 1G tol=1 pwr=0.1
R13_2P N194 0 1G
R13_3P N195 0 1G
M13_4P P202 WL13 BL13 BL13 SWNMOS
M14_4P P203 WL14 BL14 BL14 SWNMOS
M13_5P P204 WL13 BL13 BL13 SWNMOS
M14_5P P205 WL14 BL14 BL14 SWNMOS
M14_6P P206 WL14 BL14 BL14 SWNMOS
M13_6P P207 WL13 BL13 BL13 SWNMOS
M15_4P P208 WL15 BL15 BL15 SWNMOS
M15_5P P209 WL15 BL15 BL15 SWNMOS
M15_6P P210 WL15 BL15 BL15 SWNMOS
X§X14_4P IL4 P203 N212 MEM_YAKOPCIC  ; pins TE BE XSV
X§X14_5P IL5 P205 N213 MEM_YAKOPCIC  ; pins TE BE XSV
X§X14_6P IL6 P206 N214 MEM_YAKOPCIC  ; pins TE BE XSV
X§X13_4P IL4 P202 N196 MEM_YAKOPCIC  ; pins TE BE XSV
X§X13_5P IL5 P204 N197 MEM_YAKOPCIC  ; pins TE BE XSV
X§X13_6P IL6 P207 N198 MEM_YAKOPCIC  ; pins TE BE XSV
X§X15_4P IL4 P208 N228 MEM_YAKOPCIC  ; pins TE BE XSV
X§X15_5P IL5 P209 N229 MEM_YAKOPCIC  ; pins TE BE XSV
X§X15_6P IL6 P210 N230 MEM_YAKOPCIC  ; pins TE BE XSV
R14_4P N212 0 1G
R14_5P N213 0 1G
R14_6P N214 0 1G
R15_4P N228 0 1G
R15_5P N229 0 1G
R15_6P N230 0 1G
R13_4P N196 0 1G tol=1 pwr=0.1
R13_5P N197 0 1G
R13_6P N198 0 1G
M13_7P P211 WL13 BL13 BL13 SWNMOS
M14_7P P212 WL14 BL14 BL14 SWNMOS
M13_8P P213 WL13 BL13 BL13 SWNMOS
M14_8P P214 WL14 BL14 BL14 SWNMOS
M14_9P P215 WL14 BL14 BL14 SWNMOS
M13_9P P216 WL13 BL13 BL13 SWNMOS
M15_7P P217 WL15 BL15 BL15 SWNMOS
M15_8P P218 WL15 BL15 BL15 SWNMOS
M15_9P P219 WL15 BL15 BL15 SWNMOS
X§X14_7P IL7 P212 N215 MEM_YAKOPCIC  ; pins TE BE XSV
X§X14_8P IL8 P214 N216 MEM_YAKOPCIC  ; pins TE BE XSV
X§X14_9P IL9 P215 N217 MEM_YAKOPCIC  ; pins TE BE XSV
X§X13_7P IL7 P211 N199 MEM_YAKOPCIC  ; pins TE BE XSV
X§X13_8P IL8 P213 N200 MEM_YAKOPCIC  ; pins TE BE XSV
X§X13_9P IL9 P216 N201 MEM_YAKOPCIC  ; pins TE BE XSV
X§X15_7P IL7 P217 N231 MEM_YAKOPCIC  ; pins TE BE XSV
X§X15_8P IL8 P218 N232 MEM_YAKOPCIC  ; pins TE BE XSV
X§X15_9P IL9 P219 N233 MEM_YAKOPCIC  ; pins TE BE XSV
R14_7P N215 0 1G
R14_8P N216 0 1G
R14_9P N217 0 1G
R15_7P N231 0 1G
R15_8P N232 0 1G
R15_9P N233 0 1G
R13_7P N199 0 1G tol=1 pwr=0.1
R13_8P N200 0 1G
R13_9P N201 0 1G
M13_10P P220 WL13 BL13 BL13 SWNMOS
M14_10P P221 WL14 BL14 BL14 SWNMOS
M13_11P P222 WL13 BL13 BL13 SWNMOS
M14_11P P223 WL14 BL14 BL14 SWNMOS
M14_12P P224 WL14 BL14 BL14 SWNMOS
M13_12P P225 WL13 BL13 BL13 SWNMOS
M15_10P P226 WL15 BL15 BL15 SWNMOS
M15_11P P227 WL15 BL15 BL15 SWNMOS
M15_12P P228 WL15 BL15 BL15 SWNMOS
X§X14_10P IL10 P221 N218 MEM_YAKOPCIC  ; pins TE BE XSV
X§X14_11P IL11 P223 N219 MEM_YAKOPCIC  ; pins TE BE XSV
X§X14_12P IL12 P224 N220 MEM_YAKOPCIC  ; pins TE BE XSV
X§X13_10P IL10 P220 N202 MEM_YAKOPCIC  ; pins TE BE XSV
X§X13_11P IL11 P222 N203 MEM_YAKOPCIC  ; pins TE BE XSV
X§X13_12P IL12 P225 N204 MEM_YAKOPCIC  ; pins TE BE XSV
X§X15_10P IL10 P226 N234 MEM_YAKOPCIC  ; pins TE BE XSV
X§X15_11P IL11 P227 N235 MEM_YAKOPCIC  ; pins TE BE XSV
X§X15_12P IL12 P228 N236 MEM_YAKOPCIC  ; pins TE BE XSV
R14_10P N218 0 1G
R14_11P N219 0 1G
R14_12P N220 0 1G
R15_10P N234 0 1G
R15_11P N235 0 1G
R15_12P N236 0 1G
R13_10P N202 0 1G tol=1 pwr=0.1
R13_11P N203 0 1G
R13_12P N204 0 1G
M13_13P P229 WL13 BL13 BL13 SWNMOS
M14_13P P230 WL14 BL14 BL14 SWNMOS
M13_14P P231 WL13 BL13 BL13 SWNMOS
M14_14P P232 WL14 BL14 BL14 SWNMOS
M14_15P P233 WL14 BL14 BL14 SWNMOS
M13_15P P234 WL13 BL13 BL13 SWNMOS
M15_13P P235 WL15 BL15 BL15 SWNMOS
M15_14P P236 WL15 BL15 BL15 SWNMOS
M15_15P P237 WL15 BL15 BL15 SWNMOS
X§X14_13P IL13 P230 N221 MEM_YAKOPCIC  ; pins TE BE XSV
X§X14_14P IL14 P232 N222 MEM_YAKOPCIC  ; pins TE BE XSV
X§X14_15P IL15 P233 N223 MEM_YAKOPCIC  ; pins TE BE XSV
X§X13_13P IL13 P229 N205 MEM_YAKOPCIC  ; pins TE BE XSV
X§X13_14P IL14 P231 N206 MEM_YAKOPCIC  ; pins TE BE XSV
X§X13_15P IL15 P234 N207 MEM_YAKOPCIC  ; pins TE BE XSV
X§X15_13P IL13 P235 N237 MEM_YAKOPCIC  ; pins TE BE XSV
X§X15_14P IL14 P236 N238 MEM_YAKOPCIC  ; pins TE BE XSV
X§X15_15P IL15 P237 N239 MEM_YAKOPCIC  ; pins TE BE XSV
R14_13P N221 0 1G
R14_14P N222 0 1G
R14_15P N223 0 1G
R15_13P N237 0 1G
R15_14P N238 0 1G
R15_15P N239 0 1G
R13_13P N205 0 1G tol=1 pwr=0.1
R13_14P N206 0 1G
R13_15P N207 0 1G
M14_16P P238 WL14 BL14 BL14 SWNMOS
M13_16P P239 WL13 BL13 BL13 SWNMOS
M15_16P P240 WL15 BL15 BL15 SWNMOS
X§X14_16P IL16 P238 N224 MEM_YAKOPCIC  ; pins TE BE XSV
X§X13_16P IL16 P239 N208 MEM_YAKOPCIC  ; pins TE BE XSV
X§X15_16P IL16 P240 N240 MEM_YAKOPCIC  ; pins TE BE XSV
R14_16P N224 0 1G
R15_16P N240 0 1G
R13_16P N208 0 1G
M16_1P P241 WL16 BL16 BL16 SWNMOS
M16_2P P242 WL16 BL16 BL16 SWNMOS
M16_3P P243 WL16 BL16 BL16 SWNMOS
X§X16_1P IL1 P241 N241 MEM_YAKOPCIC  ; pins TE BE XSV
X§X16_2P IL2 P242 N242 MEM_YAKOPCIC  ; pins TE BE XSV
X§X16_3P IL3 P243 N243 MEM_YAKOPCIC  ; pins TE BE XSV
R16_1P N241 0 1G
R16_2P N242 0 1G
R16_3P N243 0 1G
M16_4P P244 WL16 BL16 BL16 SWNMOS
M16_5P P245 WL16 BL16 BL16 SWNMOS
M16_6P P246 WL16 BL16 BL16 SWNMOS
X§X16_4P IL4 P244 N244 MEM_YAKOPCIC  ; pins TE BE XSV
X§X16_5P IL5 P245 N245 MEM_YAKOPCIC  ; pins TE BE XSV
X§X16_6P IL6 P246 N246 MEM_YAKOPCIC  ; pins TE BE XSV
R16_4P N244 0 1G
R16_5P N245 0 1G
R16_6P N246 0 1G
M16_7P P247 WL16 BL16 BL16 SWNMOS
M16_8P P248 WL16 BL16 BL16 SWNMOS
M16_9P P249 WL16 BL16 BL16 SWNMOS
X§X16_7P IL7 P247 N247 MEM_YAKOPCIC  ; pins TE BE XSV
X§X16_8P IL8 P248 N248 MEM_YAKOPCIC  ; pins TE BE XSV
X§X16_9P IL9 P249 N249 MEM_YAKOPCIC  ; pins TE BE XSV
R16_7P N247 0 1G
R16_8P N248 0 1G
R16_9P N249 0 1G
M16_10P P250 WL16 BL16 BL16 SWNMOS
M16_11P P251 WL16 BL16 BL16 SWNMOS
M16_12P P252 WL16 BL16 BL16 SWNMOS
X§X16_10P IL10 P250 N250 MEM_YAKOPCIC  ; pins TE BE XSV
X§X16_11P IL11 P251 N251 MEM_YAKOPCIC  ; pins TE BE XSV
X§X16_12P IL12 P252 N252 MEM_YAKOPCIC  ; pins TE BE XSV
R16_10P N250 0 1G
R16_11P N251 0 1G
R16_12P N252 0 1G
M16_13P P253 WL16 BL16 BL16 SWNMOS
M16_14P P254 WL16 BL16 BL16 SWNMOS
M16_15P P255 WL16 BL16 BL16 SWNMOS
X§X16_13P IL13 P253 N253 MEM_YAKOPCIC  ; pins TE BE XSV
X§X16_14P IL14 P254 N254 MEM_YAKOPCIC  ; pins TE BE XSV
X§X16_15P IL15 P255 N255 MEM_YAKOPCIC  ; pins TE BE XSV
R16_13P N253 0 1G
R16_14P N254 0 1G
R16_15P N255 0 1G
M16_16P P256 WL16 BL16 BL16 SWNMOS
X§X16_16P IL16 P256 N256 MEM_YAKOPCIC  ; pins TE BE XSV
R16_16P N256 0 1G
Mref1 P257 WLref BLref BLref SWNMOS
Mref2 P258 WLref BLref BLref SWNMOS
Mref3 P259 WLref BLref BLref SWNMOS
Mref4 P260 WLref BLref BLref SWNMOS
Mref5 P261 WLref BLref BLref SWNMOS
Mref6 P262 WLref BLref BLref SWNMOS
Mref7 P263 WLref BLref BLref SWNMOS
Mref8 P264 WLref BLref BLref SWNMOS
Mref9 P265 WLref BLref BLref SWNMOS
Mref10 P266 WLref BLref BLref SWNMOS
Mref11 P267 WLref BLref BLref SWNMOS
Mref12 P268 WLref BLref BLref SWNMOS
Mref13 P269 WLref BLref BLref SWNMOS
Mref14 P270 WLref BLref BLref SWNMOS
Mref15 P271 WLref BLref BLref SWNMOS
Mref16 P272 WLref BLref BLref SWNMOS
Rref1 IL1 P257 {R}
Rref2 IL2 P258 {R}
Rref3 IL3 P259 {R}
Rref4 IL4 P260 {R}
Rref5 IL5 P261 {R}
Rref6 IL6 P262 {R}
Rref7 IL7 P263 {R}
Rref8 IL8 P264 {R}
Rref9 IL9 P265 {R}
Rref10 IL10 P266 {R}
Rref11 IL11 P267 {R}
Rref12 IL12 P268 {R}
Rref13 IL13 P269 {R}
Rref14 IL14 P270 {R}
Rref15 IL15 P271 {R}
Rref16 IL16 P272 {R}
.model NMOS NMOS
.model PMOS PMOS
.lib standard.mos
.inc directives.txt
.include memristor_yakopcic.sub
.model SWNMOS NMOS VTO=0.70 KP=200u LAMBDA=0.02
+ RD=1 RS=1 CGSO=0.1p CGDO=0.1p
.options defl=1u defw=100u
.param R=235.29
.tran 900m
.backanno
.end